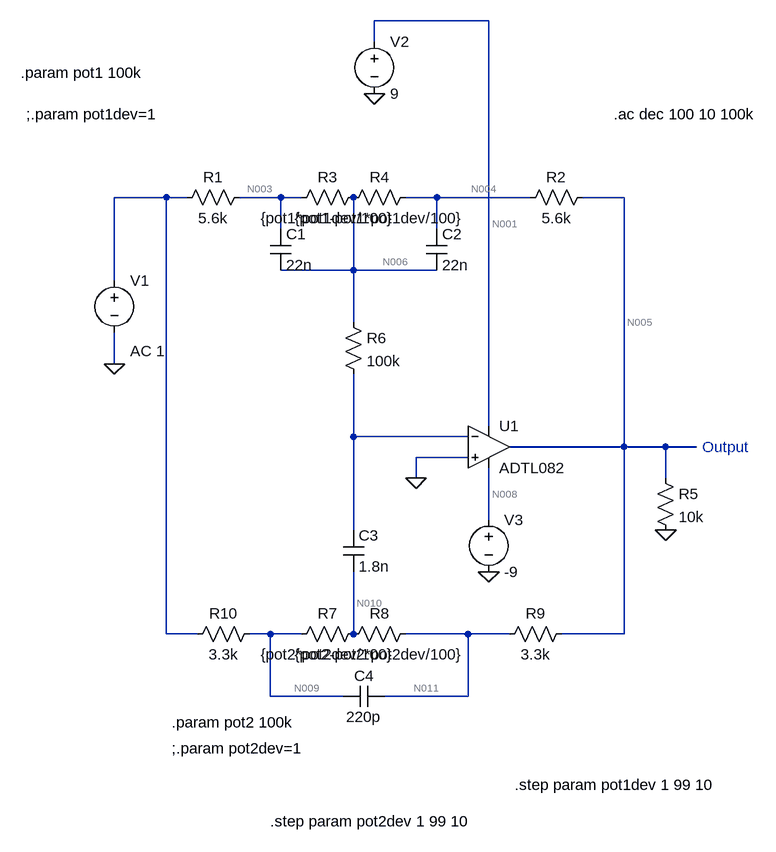
[diagram p0: schematic Baxandall Tone Circuit Test.asc]
Baxandall Tone Circuit Test.asc, the LTspice schematic file:
Version 4.1
SHEET 1 1332 976
WIRE 592 -272 416 -272
WIRE 416 -240 416 -272
WIRE 96 0 16 0
WIRE 128 0 96 0
WIRE 272 0 208 0
WIRE 304 0 272 0
WIRE 512 0 464 0
WIRE 656 0 512 0
WIRE 800 0 736 0
WIRE 272 48 272 0
WIRE 512 48 512 0
WIRE 384 112 384 0
WIRE 384 112 272 112
WIRE 512 112 384 112
WIRE 16 128 16 0
WIRE 384 192 384 112
WIRE 16 256 16 208
WIRE 592 352 592 -272
WIRE 384 368 384 272
WIRE 560 368 384 368
WIRE 800 384 800 0
WIRE 800 384 624 384
WIRE 864 384 800 384
WIRE 912 384 864 384
WIRE 560 400 480 400
WIRE 480 432 480 400
WIRE 864 432 864 384
WIRE 592 496 592 416
WIRE 384 512 384 368
WIRE 96 672 96 0
WIRE 144 672 96 672
WIRE 256 672 224 672
WIRE 304 672 256 672
WIRE 384 672 384 576
WIRE 560 672 464 672
WIRE 624 672 560 672
WIRE 800 672 800 384
WIRE 800 672 704 672
WIRE 256 768 256 672
WIRE 368 768 256 768
WIRE 560 768 560 672
WIRE 560 768 432 768
FLAG 16 256 0
FLAG 416 -160 0
FLAG 480 432 0
FLAG 864 512 0
FLAG 592 576 0
SYMBOL voltage 16 112 R0
WINDOW 123 24 124 Left 2
WINDOW 39 0 0 Left 0
SYMATTR Value2 AC 1
SYMATTR InstName V1
SYMATTR Value ""
SYMBOL res 224 -16 R90
WINDOW 0 0 56 VBottom 2
WINDOW 3 32 56 VTop 2
SYMATTR InstName R1
SYMATTR Value 5.6k
SYMBOL res 752 -16 R90
WINDOW 0 0 56 VBottom 2
WINDOW 3 32 56 VTop 2
SYMATTR InstName R2
SYMATTR Value 5.6k
SYMBOL res 400 -16 R90
WINDOW 0 0 56 VBottom 2
WINDOW 3 32 56 VTop 2
SYMATTR InstName R3
SYMATTR Value {pot1*pot1dev/100}
SYMBOL res 480 -16 R90
WINDOW 0 0 56 VBottom 2
WINDOW 3 32 56 VTop 2
SYMATTR InstName R4
SYMATTR Value {pot1-pot1*pot1dev/100}
SYMBOL cap 256 48 R0
SYMATTR InstName C1
SYMATTR Value 22n
SYMBOL cap 496 48 R0
SYMATTR InstName C2
SYMATTR Value 22n
SYMBOL OpAmps\\ADTL082 592 320 R0
SYMATTR InstName U1
SYMBOL voltage 416 -256 R0
WINDOW 123 0 0 Left 0
WINDOW 39 0 0 Left 0
SYMATTR InstName V2
SYMATTR Value 9
SYMBOL voltage 592 480 R0
WINDOW 123 0 0 Left 0
WINDOW 39 0 0 Left 0
SYMATTR InstName V3
SYMATTR Value -9
SYMBOL res 848 416 R0
SYMATTR InstName R5
SYMATTR Value 10k
SYMBOL res 368 176 R0
SYMATTR InstName R6
SYMATTR Value 100k
SYMBOL cap 368 512 R0
SYMATTR InstName C3
SYMATTR Value 1.8n
SYMBOL res 400 656 R90
WINDOW 0 0 56 VBottom 2
WINDOW 3 32 56 VTop 2
SYMATTR InstName R7
SYMATTR Value {pot2*pot2dev/100}
SYMBOL res 480 656 R90
WINDOW 0 0 56 VBottom 2
WINDOW 3 32 56 VTop 2
SYMATTR InstName R8
SYMATTR Value {pot2-pot2*pot2dev/100}
SYMBOL res 720 656 R90
WINDOW 0 0 56 VBottom 2
WINDOW 3 32 56 VTop 2
SYMATTR InstName R9
SYMATTR Value 3.3k
SYMBOL res 240 656 R90
WINDOW 0 0 56 VBottom 2
WINDOW 3 32 56 VTop 2
SYMATTR InstName R10
SYMATTR Value 3.3k
SYMBOL cap 432 752 R90
WINDOW 0 0 32 VBottom 2
WINDOW 3 32 32 VTop 2
SYMATTR InstName C4
SYMATTR Value 220p
TEXT -128 -192 Left 2 !.param pot1 100k
TEXT -120 -128 Left 2 !;.param pot1dev=1
TEXT 104 808 Left 2 !.param pot2 100k
TEXT 104 848 Left 2 !;.param pot2dev=1
TEXT 784 -128 Left 2 !.ac dec 100 10 100k
TEXT 920 384 Left 2 ;Output
TEXT 256 960 Left 2 !.step param pot2dev 1 99 10
TEXT 632 904 Left 2 !.step param pot1dev 1 99 10

The netlist it stands for:
* Baxandall Tone Circuit Test.asc
V1 N002 0 AC 1
R1 N003 N002 5.6k
R2 N005 N004 5.6k
R3 N006 N003 {pot1*pot1dev/100}
R4 N004 N006 {pot1-pot1*pot1dev/100}
C1 N003 N006 22n
C2 N004 N006 22n
X§U1 0 N007 N001 N008 N005 ADTL082  ; pins In+ In- V+ V- OUT
V2 N001 0 9
V3 N008 0 -9
R5 N005 0 10k
R6 N006 N007 100k
C3 N007 N010 1.8n
R7 N010 N009 {pot2*pot2dev/100}
R8 N011 N010 {pot2-pot2*pot2dev/100}
R9 N005 N011 3.3k
R10 N009 N002 3.3k
C4 N011 N009 220p
.param pot1 100k
;.param pot1dev=1
.param pot2 100k
;.param pot2dev=1
.ac dec 100 10 100k
* Output
.step param pot2dev 1 99 10
.step param pot1dev 1 99 10
.lib ADI.lib
.backanno
.end

* Results of the author's LTspice run, read from the files saved beside the schematic
* Operating Point (first step), zero values left out:
*   V(n001) = 9 V
*   V(n003) = 169.7 nV
*   V(n004) = 3.398 µV
*   V(n005) = 3.579 µV
*   V(n006) = 200 nV
*   V(n008) = -9 V
*   V(n009) = 110.8 nV
*   V(n010) = 144.4 nV
*   V(n011) = 3.468 µV
*   I(R1) = 30.3 pA
*   I(R10) = 33.57 pA
*   I(R2) = 32.3 pA
*   I(R3) = 30.3 pA
*   I(R4) = 32.3 pA
*   I(R5) = 357.9 pA
*   I(R6) = 2 pA
*   I(R7) = 33.57 pA
*   I(R8) = 33.57 pA
*   I(R9) = 33.57 pA
*   I(V1) = 63.87 pA
*   I(V2) = -4.816 mA
*   I(V3) = 4.816 mA
*   Ix(u1:1) = 2 pA
*   Ix(u1:2) = 2 pA
*   Ix(u1:3) = 4.816 mA
*   Ix(u1:4) = -4.816 mA
*   Ix(u1:5) = -423.8 pA
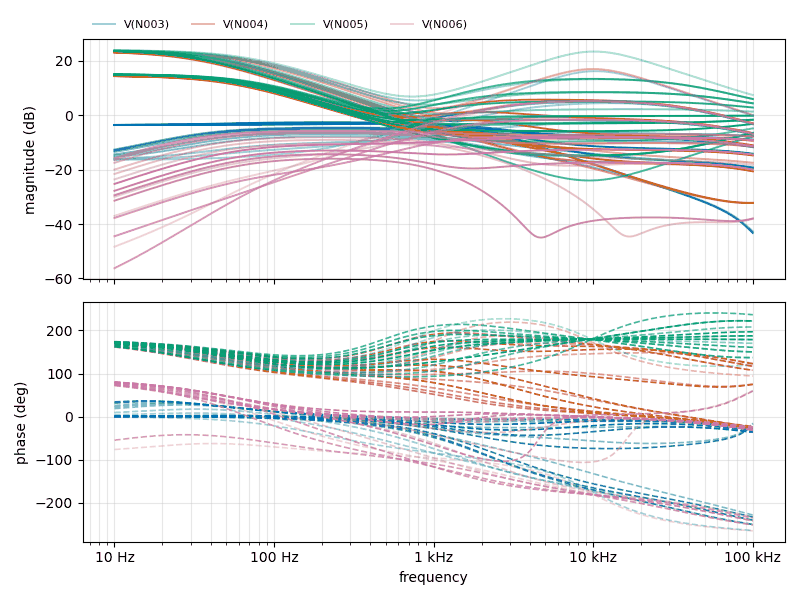
[diagram p1: AC Analysis of Baxandall Tone Circuit Test.asc, plotted from the saved traces]
* AC Analysis, 21 runs:
*   V(N003) [run 1]: -16.34 dB at 10 Hz, -0.11 dB at 100 kHz, peak 16.25 dB at 10.23 kHz, 3 dB below the peak at 5.441 kHz and 20.1 kHz
*   V(N003) [run 2]: -16.20 dB at 10 Hz, -3.26 dB at 100 kHz, peak 4.50 dB at 12.59 kHz, 3 dB below the peak at 2.855 kHz and 46.75 kHz
*   V(N003) [run 3]: -15.96 dB at 10 Hz, -7.02 dB at 100 kHz, peak -2.38 dB at 16.22 kHz, 3 dB below the peak at 1.945 kHz and 72.71 kHz
*   V(N003) [run 4]: -15.24 dB at 10 Hz, -18.96 dB at 100 kHz, peak -7.74 dB at 245.5 Hz, 3 dB below the peak at 37.19 Hz and 1.56 kHz
*   V(N003) [run 5]: -14.81 dB at 10 Hz, -42.66 dB at 100 kHz, peak -6.92 dB at 229.1 Hz, 3 dB below the peak at 35.36 Hz and 1.471 kHz
*   V(N003) [run 6]: -14.35 dB at 10 Hz, -19.35 dB at 100 kHz, peak -6.24 dB at 223.9 Hz, 3 dB below the peak at 33.63 Hz and 1.69 kHz
*   V(N003) [run 7]: -13.42 dB at 10 Hz, -11.09 dB at 100 kHz, peak -5.21 dB at 229.1 Hz, 3 dB below the peak at 30.5 Hz and 4.807 kHz
*   V(N003) [run 8]: -12.95 dB at 10 Hz, -8.96 dB at 100 kHz, peak -4.80 dB at 239.9 Hz, 3 dB below the peak at 29.13 Hz and 25.21 kHz
*   V(N004) [run 1]: 23.43 dB at 10 Hz, 0.12 dB at 100 kHz, peak 23.43 dB at 10 Hz, 3 dB below the peak at 70.7 Hz
*   V(N004) [run 2]: 23.41 dB at 10 Hz, -2.94 dB at 100 kHz, peak 23.41 dB at 10 Hz, 3 dB below the peak at 63.4 Hz
*   V(N004) [run 3]: 23.38 dB at 10 Hz, -6.57 dB at 100 kHz, peak 23.38 dB at 10 Hz, 3 dB below the peak at 57.41 Hz
*   V(N004) [run 4]: 23.32 dB at 10 Hz, -17.45 dB at 100 kHz, peak 23.32 dB at 10 Hz, 3 dB below the peak at 48.34 Hz
*   V(N004) [run 5]: 23.29 dB at 10 Hz, -32.23 dB at 100 kHz, peak 23.29 dB at 10 Hz, 3 dB below the peak at 44.89 Hz
*   V(N004) [run 6]: 23.25 dB at 10 Hz, -20.57 dB at 100 kHz, peak 23.25 dB at 10 Hz, 3 dB below the peak at 41.96 Hz
*   V(N004) [run 7]: 23.17 dB at 10 Hz, -11.51 dB at 100 kHz, peak 23.17 dB at 10 Hz, 3 dB below the peak at 37.3 Hz
*   V(N004) [run 8]: 23.13 dB at 10 Hz, -9.26 dB at 100 kHz, peak 23.13 dB at 10 Hz, 3 dB below the peak at 35.43 Hz
*   V(N005) [run 1]: 23.91 dB at 10 Hz, 7.47 dB at 100 kHz, peak 23.91 dB at 10 Hz, 3 dB below the peak at 70.93 Hz
*   V(N005) [run 2]: 23.89 dB at 10 Hz, 6.01 dB at 100 kHz, peak 23.89 dB at 10 Hz, 3 dB below the peak at 63.52 Hz
*   V(N005) [run 3]: 23.86 dB at 10 Hz, 4.43 dB at 100 kHz, peak 23.86 dB at 10 Hz, 3 dB below the peak at 57.47 Hz
*   V(N005) [run 4]: 23.80 dB at 10 Hz, 1.37 dB at 100 kHz, peak 23.80 dB at 10 Hz, 3 dB below the peak at 48.34 Hz
*   V(N005) [run 5]: 23.77 dB at 10 Hz, -0.12 dB at 100 kHz, peak 23.77 dB at 10 Hz, 3 dB below the peak at 44.87 Hz
*   V(N005) [run 6]: 23.73 dB at 10 Hz, -1.61 dB at 100 kHz, peak 23.73 dB at 10 Hz, 3 dB below the peak at 41.93 Hz
*   V(N005) [run 7]: 23.65 dB at 10 Hz, -4.79 dB at 100 kHz, peak 23.65 dB at 10 Hz, 3 dB below the peak at 37.27 Hz
*   V(N005) [run 8]: 23.61 dB at 10 Hz, -6.46 dB at 100 kHz, peak 23.61 dB at 10 Hz, 3 dB below the peak at 35.39 Hz
*   V(N006) [run 1]: -48.32 dB at 10 Hz, 0.01 dB at 100 kHz, peak 16.86 dB at 10 kHz, 3 dB below the peak at 5.161 kHz and 19.27 kHz
*   V(N006) [run 2]: -36.99 dB at 10 Hz, -3.10 dB at 100 kHz, peak 5.27 dB at 9.12 kHz, 3 dB below the peak at 2.366 kHz and 41.64 kHz
*   V(N006) [run 3]: -29.99 dB at 10 Hz, -6.79 dB at 100 kHz, peak -1.38 dB at 7.244 kHz, 3 dB below the peak at 1.57 kHz and 61.34 kHz
*   V(N006) [run 4]: -23.56 dB at 10 Hz, -18.17 dB at 100 kHz, peak -10.30 dB at 281.8 Hz, 3 dB below the peak at 43.92 Hz and 2.918 kHz
*   V(N006) [run 5]: -21.57 dB at 10 Hz, -38.06 dB at 100 kHz, peak -9.05 dB at 223.9 Hz, 3 dB below the peak at 39.87 Hz and 1.265 kHz
*   V(N006) [run 6]: -19.96 dB at 10 Hz, -20.00 dB at 100 kHz, peak -8.04 dB at 213.8 Hz, 3 dB below the peak at 37.08 Hz and 1.265 kHz
*   V(N006) [run 7]: -17.47 dB at 10 Hz, -11.31 dB at 100 kHz, peak -6.58 dB at 218.8 Hz, 3 dB below the peak at 32.87 Hz and 2.124 kHz
*   V(N006) [run 8]: -16.46 dB at 10 Hz, -9.12 dB at 100 kHz, peak -6.02 dB at 223.9 Hz, 3 dB below the peak at 31.19 Hz and 95.5 kHz